# Altium schematic sheet DC_Motor_Driver.SchDoc
size 431 x 279 mm; SheetNumber: 4; SheetTotal: 6
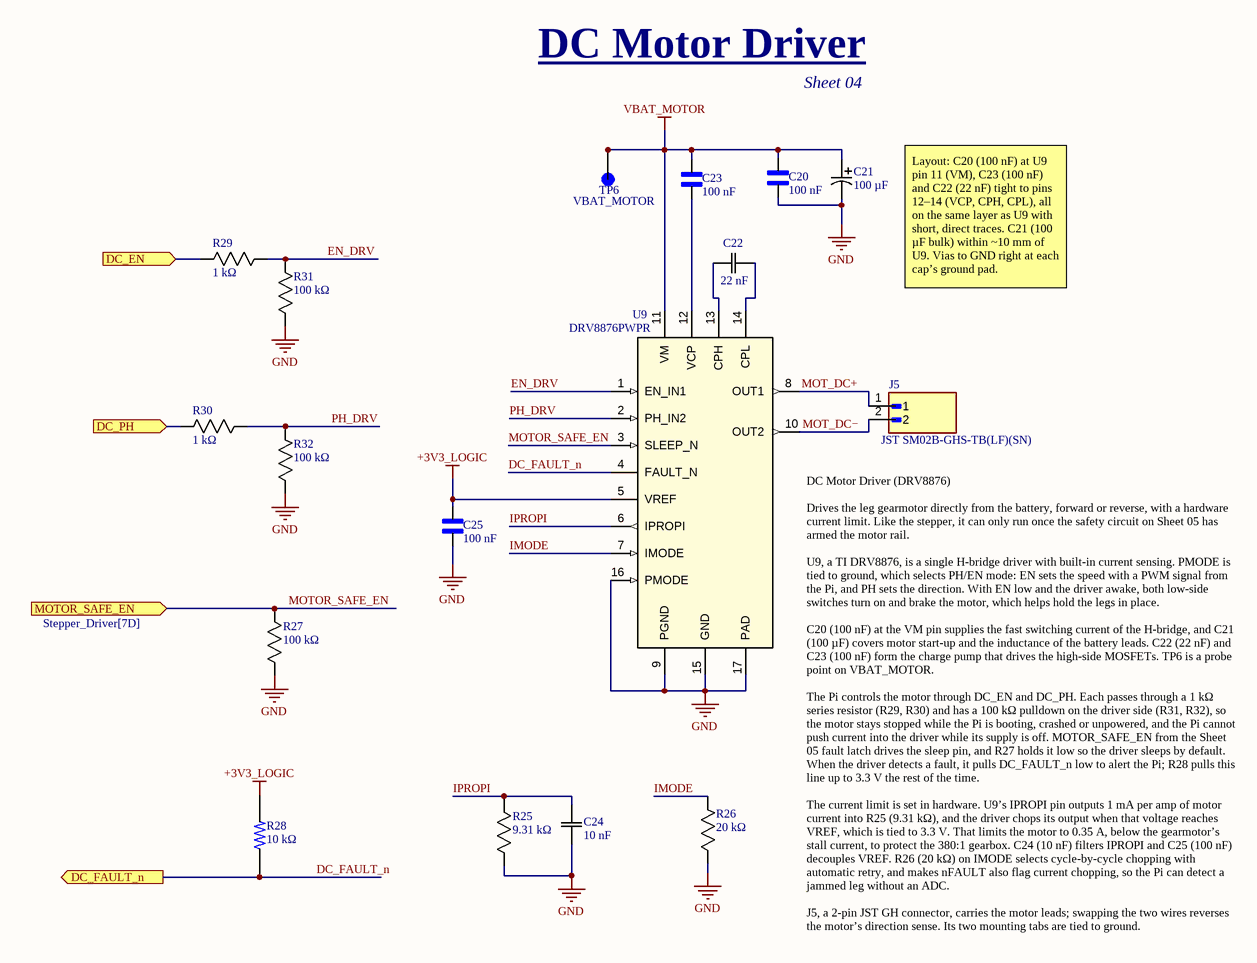
[diagram p0: DC_Motor_Driver.SchDoc]

## Parts
C20  100 nF  [CAPC1608X90N]
C21  100 µF  [CAP_8 X 6.2_PAN]
C22  22 nF  [G-188_MUR]
C23  100 nF  [CAPC1608X90N]
C24  10 nF  [CC0603N_YAG]
C25  100 nF  [CAPC1608X90N]
J5  JST SM02B-GHS-TB(LF)(SN)  [JST_SM02B-GHS-TB(LF)(SN)]
R25  9.31 kΩ  [RC0603N_YAG]
R26  20 kΩ  [RES_RC0603_YAG]
R27  100 kΩ  [RC0603N_YAG]
R28  10 kΩ  [RESC1607X60N]
R29  1 kΩ  [RC0603N_YAG]
R30  1 kΩ  [RC0603N_YAG]
R31  100 kΩ  [RC0603N_YAG]
R32  100 kΩ  [RC0603N_YAG]
TP6  VBAT_MOTOR  [KEYSTONE_5015]
U9  DRV8876PWPR  [PWP0016J_N]

## Ports
DC_EN (in), DC_FAULT_n (out), DC_PH (in), MOTOR_SAFE_EN (in, see Stepper_Driver[7D])

## Nets
+3V3_LOGIC: C25.2 R28.2 U9.5(VREF)
GND: C20.1 C21.2 C24.1 C25.1 R25.2 R26.1 R27.1 R31.1 R32.1 U9.9(PGND) U9.15(GND) U9.16(PMODE) U9.17(PAD)
VBAT_MOTOR: C20.2 C21.1 C23.2 TP6.TP U9.11(VM)
DC_EN: R29.1 ; port DC_EN
DC_FAULT_n: R28.1 U9.4(FAULT_N) ; port DC_FAULT_n
DC_PH: R30.1 ; port DC_PH
EN_DRV: R29.2 R31.2 U9.1(EN_IN1)
IMODE: R26.2 U9.7(IMODE)
IPROPI: C24.2 R25.1 U9.6(IPROPI)
MOT_DC+: J5.1 U9.8(OUT1)
MOT_DC−: J5.2 U9.10(OUT2)
MOTOR_SAFE_EN: R27.2 U9.3(SLEEP_N) ; port MOTOR_SAFE_EN
PH_DRV: R30.2 R32.2 U9.2(PH_IN2)
NetC22_1: C22.1 U9.13(CPH)
NetC22_2: C22.2 U9.14(CPL)
NetC23_1: C23.1 U9.12(VCP)

## Notes on the sheet
- DC Motor Driver
- Sheet 04
- Layout: C20 (100 nF) at U9 pin 11 (VM), C23 (100 nF) and C22 (22 nF) tight to pins 12–14 (VCP, CPH, CPL), all on the same layer as U9 with short, direct traces. C21 (100 µF bulk) within ~10 mm of U9. Vias to GND right at each cap’s ground pad.
- DC Motor Driver (DRV8876)
  Drives the leg gearmotor directly from the battery, forward or reverse, with a hardware current limit. Like the stepper, it can only run once the safety circuit on Sheet 05 has armed the motor rail.
  U9, a TI DRV8876, is a single H-bridge driver with built-in current sensing. PMODE is tied to ground, which selects PH/EN mode: EN sets the speed with a PWM signal from the Pi, and PH sets the direction. With EN low and the driver awake, both low-side switches turn on and brake the motor, which helps hold the legs in place.
  C20 (100 nF) at the VM pin supplies the fast switching current of the H-bridge, and C21 (100 µF) covers motor start-up and the inductance of the battery leads. C22 (22 nF) and C23 (100 nF) form the charge pump that drives the high-side MOSFETs. TP6 is a probe point on VBAT_MOTOR.
  The Pi controls the motor through DC_EN and DC_PH. Each passes through a 1 kΩ series resistor (R29, R30) and has a 100 kΩ pulldown on the driver side (R31, R32), so the motor stays stopped while the Pi is booting, crashed or unpowered, and the Pi cannot push current into the driver while its supply is off. MOTOR_SAFE_EN from the Sheet 05 fault latch drives the sleep pin, and R27 holds it low so the driver sleeps by default. When the driver detects a fault, it pulls DC_FAULT_n low to alert the Pi; R28 pulls this line up to 3.3 V the rest of the time.
  The current limit is set in hardware. U9’s IPROPI pin outputs 1 mA per amp of motor current into R25 (9.31 kΩ), and the driver chops its output when that voltage reaches VREF, which is tied to 3.3 V. That limits the motor to 0.35 A, below the gearmotor’s stall current, to protect the 380:1 gearbox. C24 (10 nF) filters IPROPI and C25 (100 nF) decouples VREF. R26 (20 kΩ) on IMODE selects cycle-by-cycle chopping with automatic retry, and makes nFAULT also flag current chopping, so the Pi can detect a jammed leg without an ADC.
  J5, a 2-pin JST GH connector, carries the motor leads; swapping the two wires reverses the motor’s direction sense. Its two mounting tabs are tied to ground.
- DWG. NO.
- REV.
- SHT.
- THIS DOCUMENT AND THE DATA DISCLOSED HEREIN OR HEREWITH IS THE PROPERTY OF ALTIUM LIMITED AND MAY BE FREELY DISTRIBUTED IN WHOLE. NO RIGHTS ARE RESERVED OR EXPRESS OR IMPLIED WARANTEE GIVEN.
- REVISION
- DESCRIPTION
- DATE
- APPROVED
- ENG:
- APPROVALS
- PROJECT
- DSN:
- CHK:
- REFERENCE DOCUMENTS
- PROJECT REVISION:
- TITLE
- DOCUMENT REVISION:
- DESIGN ITEM:
- BOM:
- FAB DWG:
- PCB DWG:
- ASSY DWG:
- SCALE:
- SIZE
- B
- CAGE CODE
- FILE NAME
- DWG NO.
- SHEET
- OF
- REV

## Library data of the parts
C20 = GRM188R71H104KA93D: SMD Capacitor X7R(EIA) with Capacitance: 0.10uF Tol. 10%. Rated Voltage: 50Vdc / GRM188R71H104KA93D / VM decoupling at pin 11 / https://www.digikey.com/en/products/result?keywords=GRM188R71H104KA93D /; MF: Murata; SnapEDA_Link: https://www.snapeda.com/parts/GRM188R71H104KA93D/Murata/view-part/?ref=snap; Package: 1608 Murata; Value: *; MP: GRM188R71H104KA93D; Check_prices: https://www.snapeda.com/parts/GRM188R71H104KA93D/Murata/view-part/?ref=eda
C21 = EEE-FK1E101P: Panasonic EEE-FK1E101P / 100 µF 25 V aluminum / VBAT_MOTOR bulk at U9 / https://www.digikey.com/en/products/detail/panasonic-industry/EEE-FK1E101P/765965; Copyright: Copyright (C) 2025 Ultra Librarian. All rights reserved.; Manufacturer_Name: Panasonic; Manufacturer_Part_Number: EEE-FK1E101P
C22 = GRM188R71H223KA01D: Murata GRM188R71H223KA01D / 22 nF 50 V X7R / Charge pump CPH–CPL / https://www.digikey.com/en/products/result?keywords=GRM188R71H223KA01D; Copyright: Copyright (C) 2026 Ultra Librarian. All rights reserved.; Manufacturer_Name: Murata; Manufacturer_Part_Number: GRM188R71H223KA01D
C23 = GRM188R71H104KA93D: SMD Capacitor X7R(EIA) with Capacitance: 0.10uF Tol. 10%. Rated Voltage: 50Vdc / Murata GRM188R71H104KA93D / 100 nF 50 V X7R (TI asks for 16 V or more) / VCP to VM / https://www.digikey.com/en/products/result?keywords=GRM188R71H104KA93D; SnapEDA_Link: https://www.snapeda.com/parts/GRM188R71H104KA93D/Murata/view-part/?ref=snap; Package: 1608 Murata; Value: *; MF: Murata; MP: GRM188R71H104KA93D; Check_prices: https://www.snapeda.com/parts/GRM188R71H104KA93D/Murata/view-part/?ref=eda
C24 = CC0603KRX7R9BB103: Yageo CC0603KRX7R9BB103 / 10 nF 50 V X7R / 0603 / IPROPI filter, at the pin (per TI) / https://www.digikey.com/en/products/result?keywords=CC0603KRX7R9BB103; Copyright: Copyright (C) 2025 Ultra Librarian. All rights reserved.; Manufacturer_Name: Yageo; Manufacturer_Part_Number: CC0603KRX7R9BB103
C25 = GRM188R71H104KA93D: Murata GRM188R71H104KA93D / 100 nF 50 V X7R / 0603 / VREF bypass (VREF tied to +3V3_LOGIC) / https://www.digikey.com/en/products/result?keywords=GRM188R71H104KA93D; SnapEDA_Link: https://www.snapeda.com/parts/GRM188R71H104KA93D/Murata/view-part/?ref=snap; Package: 1608 Murata; Value: *; MF: Murata; MP: GRM188R71H104KA93D; Check_prices: https://www.snapeda.com/parts/GRM188R71H104KA93D/Murata/view-part/?ref=eda
J5 = SM02B-GHS-TB(LF)(SN): JST SM02B-GHS-TB(LF)(SN) / 2-pin GH, 1.25 mm, 1 A per contact / Right-angle SMD, 2 mounting tabs / Leg gearmotor / https://octopart.com/part/jst/SM02B-GHS-TB%28LF%29%28SN%29; MF: JST Sales; SnapEDA_Link: https://www.snapeda.com/parts/SM02B-GHS-TB(LF)(SN)/JST/view-part/?ref=snap; Package: None; Value: *; MP: SM02B-GHS-TB(LF)(SN); Check_prices: https://www.snapeda.com/parts/SM02B-GHS-TB(LF)(SN)/JST/view-part/?ref=eda
R25 = RC0603FR-079K31L: Yageo RC0603FR-079K31L / 9.31 kΩ 1 % / 0603 / R_IPROPI: 3.3 V / (9.31 kΩ × 1000 µA/A) = 0.35 A current limit / https://www.digikey.com/en/products/result?keywords=RC0603FR-079K31L; Copyright: Copyright (C) 2025 Ultra Librarian. All rights reserved.; Manufacturer_Name: Yageo; Manufacturer_Part_Number: RC0603FR-079K31L
R26 = RC0603FR-0720KL: Yageo RC0603FR-0720KL / 20 kΩ 1 % / 0603 / IMODE: cycle-by-cycle chopping, auto retry, nFAULT also flags chopping (jam detect without an ADC) / https://www.digikey.com/en/products/result?keywords=RC0603FR-0720KL; Copyright: Copyright (C) 2026 Ultra Librarian. All rights reserved.; Manufacturer_Name: Yageo; Manufacturer_Part_Number: RC0603FR-0720KL
R27 = RC0603FR-07100KL: Yageo RC0603FR-07100KL / 100 kΩ 1 % / 0603 / nSLEEP pulldown / https://www.digikey.com/en/products/result?keywords=RC0603FR-07100KL; Copyright: Copyright (C) 2025 Ultra Librarian. All rights reserved.; Manufacturer_Name: Yageo; Manufacturer_Part_Number: RC0603FR-07100KL
R28 = RC0603FR-0710KL: Yageo RC0603FR-0710KL / 10 kΩ 1 % / 0603 / nFAULT pull-up → DC_FAULT_n / https://www.digikey.com/en/products/result?keywords=RC0603FR-0710KL; SnapEDA_Link: https://www.snapeda.com/parts/RC0603FR-0710KL/Yageo/view-part/?ref=snap; Package: 0603 Yageo; Value: *; MF: Yageo; MP: RC0603FR-0710KL; Check_prices: https://www.snapeda.com/parts/RC0603FR-0710KL/Yageo/view-part/?ref=eda
R29 R30 = RC0603FR-071KL: Yageo RC0603FR-071KL / 1 kΩ 1 % / 0603 / Series on EN, PH / https://www.digikey.com/en/products/result?keywords=RC0603FR-071KL; Copyright: Copyright (C) 2025 Ultra Librarian. All rights reserved.; Manufacturer_Name: Yageo; Manufacturer_Part_Number: RC0603FR-071KL
R31 R32 = RC0603FR-07100KL: Yageo RC0603FR-07100KL / 100 kΩ 1 % / 0603 / Pulldowns on EN, PH, driver side / https://www.digikey.com/en/products/result?keywords=RC0603FR-07100KL; Copyright: Copyright (C) 2025 Ultra Librarian. All rights reserved.; Manufacturer_Name: Yageo; Manufacturer_Part_Number: RC0603FR-07100KL
TP6 = 5015: Test Point Micro Mini SMT Phos Bronze/Silver 1000pc Tape & Reel | Keystone Electronics 5015; SnapEDA_Link: https://www.snapeda.com/parts/5015/Keystone/view-part/?ref=snap; Package: None; Value: *; MF: Keystone Electronics; MP: 5015; Check_prices: https://www.snapeda.com/parts/5015/Keystone/view-part/?ref=eda
U9 = DRV8876PWPR: 40-V, 3.5-A H-bridge motor driver with integrated current sensing &amp; current-sense feedback 16-HTSSOP -40 to 125 / Leg motor H-bridge; PMODE to GND = PH/EN mode / https://www.digikey.com/en/products/detail/texas-instruments/DRV8876PWPR/10270213; Manufacturer_Name: Texas Instruments; TYPE: TYPE; RefDes: RefDes; Copyright: Copyright (C) 2026 Ultra Librarian. All rights reserved.; Manufacturer_Part_Number: DRV8876PWPR